# Altium schematic sheet P1.schdoc
size 420 x 298 mm; Symbol: Sheet-Symbol_A3; Company: 深圳嘉立创科技发展有限公司; Drawed: 嘉立创EDA; Reviewed: 嘉立创EDA; Version: V0.1; Page Size: A3; Part Number: JLCPCB-001; @Page No: 1; @Page Name: P1; Convert to PCB: yes; Add into BOM: yes; @Project Name: DAPlink-DOWN; @Page Count: 1; @Update Date: 2023-02-24; @Create Date: 2022-05-03; @Schematic Name: Schematic1; Device: Sheet-Symbol_A3
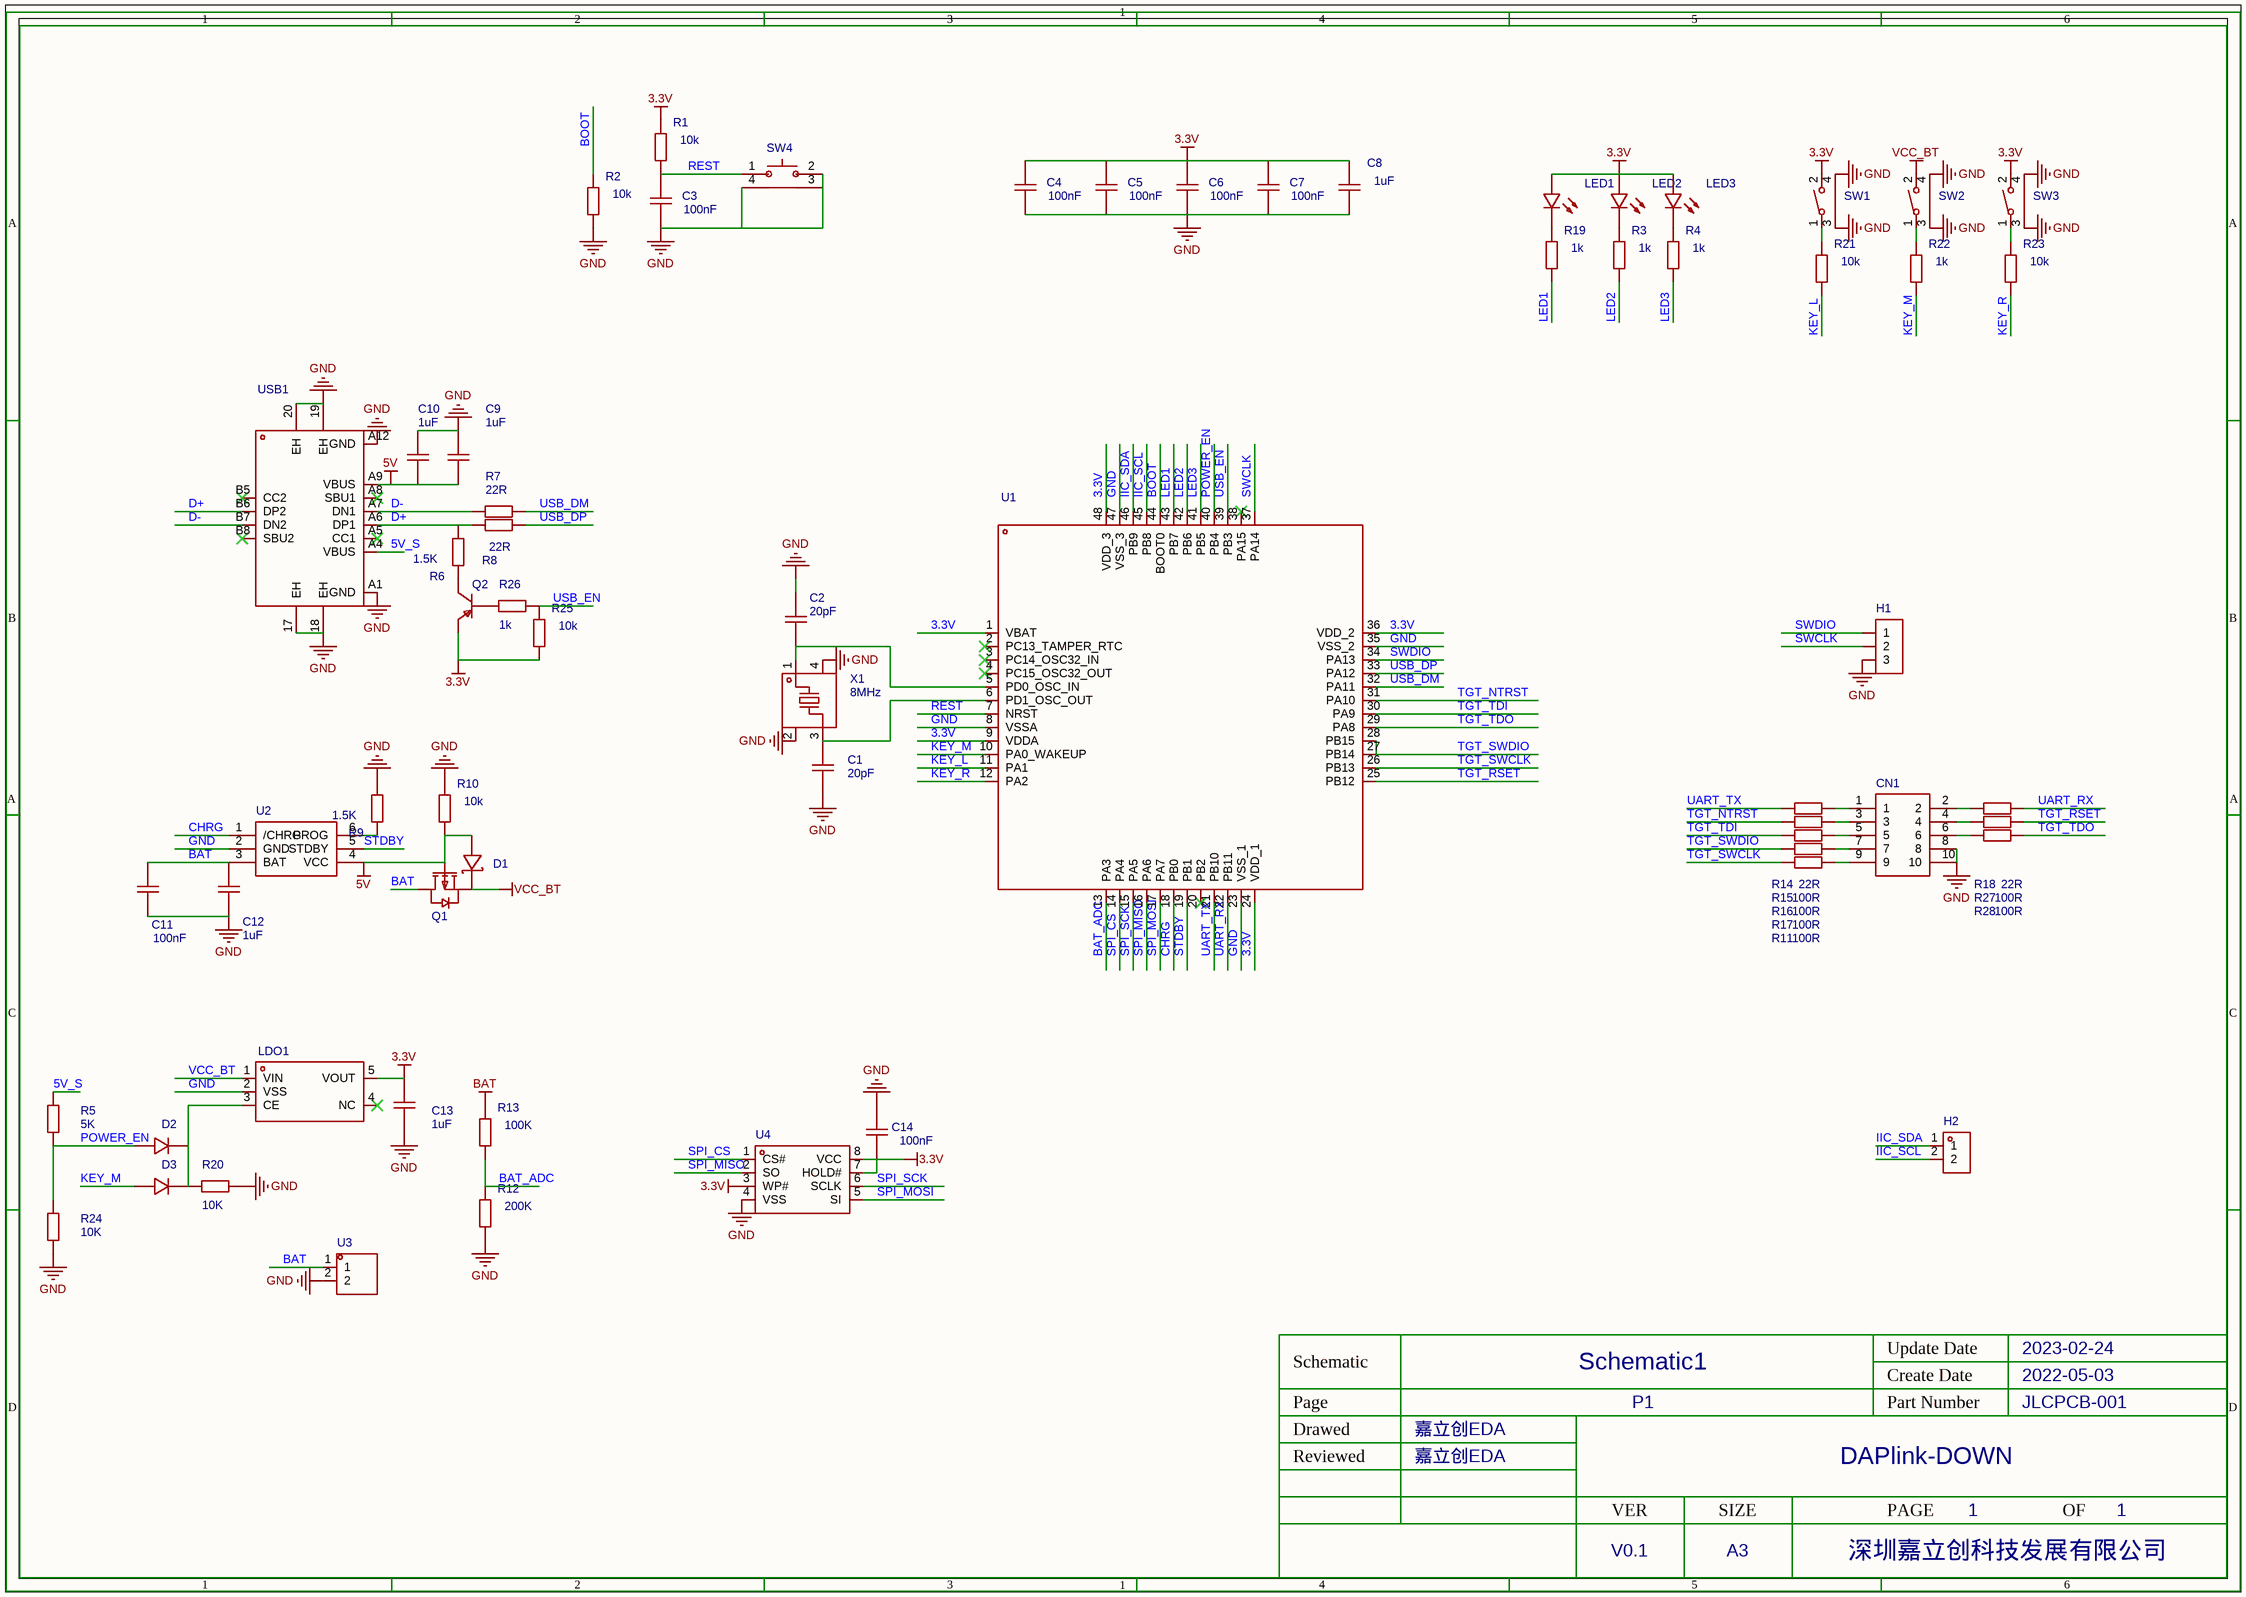
[diagram p0: P1.schdoc]

## Parts
C1  value 20pF  [C0402]
C2  value 20pF  [C0402]
C3  value 100nF  [C0402]
C4  value 100nF  [C0402]
C5  value 100nF  [C0402]
C6  value 100nF  [C0402]
C7  value 100nF  [C0402]
C8  value 1uF  [C0603]
C9  value 1uF  [C0603]
C10  value 1uF  [C0805]
C11  value 100nF  [C0402]
C12  value 1uF  [C0603]
C13  value 1uF  [C0603]
C14  value 100nF  [C0402]
CN1  (no value)  [IDC-TH_10P-P2.54_Z-231012010106]
D1  (no value)  [SOD-123_L2.8-W1.8-LS3.7-RD]
D2  1N4007WS  [SOD-323_L1.8-W1.3-LS2.5-RD]  (value not drawn)
D3  1N4007WS  [SOD-323_L1.8-W1.3-LS2.5-RD]  (value not drawn)
H1  (no value)  [HDR-TH_3P-P2.54-V-M-1]
H2  PZ254V-11-02P  [HDR-TH_2P-P2.54-V-M]  (value not drawn)
LDO1  (no value)  [SOT-23-5_L3.0-W1.7-P0.95-LS2.8-BR]
LED1  (no value)  [LED0603-R-RD]
LED2  (no value)  [LED0603-R-RD]
LED3  (no value)  [LED0603-R-RD]
Q1  (no value)  [SOT-23-3_L2.9-W1.3-P1.90-LS2.4-BR]
Q2  S8550  [SOT-23-3_L2.9-W1.6-P1.90-LS2.8-BR]  (value not drawn)
R1  value 10k  [R0402]
R2  value 10k  [R0402]
R3  value 1k  [R0402]
R4  value 1k  [R0402]
R5  value 5K  [R0402]
R6  value 1.5K  [R0402]
R7  value 22R  [R0402]
R8  value 22R  [R0402]
R9  value 1.5K  [R0402]
R10  value 10k  [R0402]
R11  value 100R  [R0402]
R12  value 200K  [R0402]
R13  value 100K  [R0402]
R14  value 22R  [R0402]
R15  value 100R  [R0402]
R16  value 100R  [R0402]
R17  value 100R  [R0402]
R18  value 22R  [R0402]
R19  value 1k  [R0402]
R20  value 10K  [R0402]
R21  value 10k  [R0402]
R22  value 1k  [R0402]
R23  value 10k  [R0402]
R24  value 10K  [R0402]
R25  value 10k  [R0402]
R26  value 1k  [R0402]
R27  value 100R  [R0402]
R28  value 100R  [R0402]
SW1  (no value)  [SW-TH_TS-1093C-A6B3-D1]
SW2  (no value)  [SW-TH_TS-1093C-A6B3-D1]
SW3  (no value)  [SW-TH_TS-1093C-A6B3-D1]
SW4  1TS003B-1400-3500A-CT  [KEY-SMD_1TS003B]  (value not drawn)
U1  (no value)  [LQFP-48_L7.0-W7.0-P0.50-LS9.0-BL]
U2  (no value)  [SOT-23-6_L2.9-W1.6-P0.95-LS2.8-BR]
U3  (no value)  [CONN-TH_T2B-SQ-LF-SN]
U4  (no value)  [SOP-8_L5.3-W5.2-P1.27-LS7.9-BL]
USB1  (no value)  [USB-C-SMD_TYPE-C-16P-QTGM027]
X1  value 8MHz  [OSC-SMD_4P-L3.2-W2.5-BL]

## Nets
3.3V: C4.2 C5.2 C6.2 C7.2 C8.2 C13.2 C14.1 LDO1.5(VOUT) LED1.1(A) LED2.1(A) LED3.1(A) Q2.2 R1.2 R25.1 SW1.2 SW3.2 U1.1(VBAT) U1.9(VDDA) U1.24(VDD_1) U1.36(VDD_2) U1.48(VDD_3) U4.3(WP#) U4.7(HOLD#) U4.8(VCC)
5V: C9.1 C10.1 D1.2(A) Q1.1(G) R10.1 U2.4(VCC) USB1.A9(VBUS)
BAT: C11.2 C12.2 Q1.3(D) R13.2 U2.3(BAT) U3.1
GND: C1.2 C2.1 C3.1 C4.1 C5.1 C6.1 C7.1 C8.1 C9.2 C10.2 C11.1 C12.1 C13.1 C14.2 CN1.8 CN1.10 H1.3 LDO1.2(VSS) R2.1 R9.1 R10.2 R12.1 R20.1 R24.1 SW1.3(EP) SW1.4(EP) SW2.3(EP) SW2.4(EP) SW3.3(EP) SW3.4(EP) SW4.2 SW4.3 SW4.4 U1.8(VSSA) U1.23(VSS_1) U1.35(VSS_2) U1.47(VSS_3) U2.2(GND) U3.2 U4.4(VSS) USB1.17(EH) USB1.18(EH) USB1.19(EH) USB1.20(EH) USB1.A1(GND) USB1.A12(GND) X1.2(GND) X1.4(GND)
VCC_BT: D1.1(K) LDO1.1(VIN) Q1.2(S) SW2.2
5V_S: R5.2 USB1.A4(VBUS)
BAT_ADC: R12.2 R13.1 U1.13(PA3)
BOOT: R2.2 U1.44(BOOT0)
CHRG: U1.18(PB0) U2.1(/CHRG)
D+: R6.1 R8.2 USB1.A6(DP1) USB1.B6(DP2)
D-: R7.1 USB1.A7(DN1) USB1.B7(DN2)
IIC_SCL: H2.2 U1.45(PB8)
IIC_SDA: H2.1 U1.46(PB9)
KEY_L: R21.1 U1.11(PA1)
KEY_M: D3.2(A) R22.1 U1.10(PA0_WAKEUP)
KEY_R: R23.1 U1.12(PA2)
LED1: R19.1 U1.43(PB7)
LED2: R3.1 U1.42(PB6)
LED3: R4.1 U1.41(PB5)
POWER_EN: D2.2(A) R5.1 R24.2 U1.40(PB4)
REST: C3.2 R1.1 SW4.1 U1.7(NRST)
SPI_CS: U1.14(PA4) U4.1(CS#)
SPI_MISO: U1.16(PA6) U4.2(SO)
SPI_MOSI: U1.17(PA7) U4.5(SI)
SPI_SCK: U1.15(PA5) U4.6(SCLK)
STDBY: U1.19(PB1) U2.5(STDBY)
SWCLK: H1.2 U1.37(PA14)
SWDIO: H1.1 U1.34(PA13)
TGT_NTRST: R15.2 U1.31(PA10)
TGT_RSET: R27.1 U1.25(PB12)
TGT_SWCLK: R11.2 U1.26(PB13)
TGT_SWDIO: R17.2 U1.27(PB14) U1.28(PB15)
TGT_TDI: R16.2 U1.30(PA9)
TGT_TDO: R28.1 U1.29(PA8)
UART_RX: R18.1 U1.22(PB11)
UART_TX: R14.2 U1.21(PB10)
USB_DM: R7.2 U1.32(PA11)
USB_DP: R8.1 U1.33(PA12)
USB_EN: R25.2 R26.1 U1.39(PB3)
NetC1_1: C1.1 U1.6(PD1_OSC_OUT) X1.3
NetC2_2: C2.2 U1.5(PD0_OSC_IN) X1.1
NetCN1_1: CN1.1 R14.1
NetCN1_2: CN1.2 R18.2
NetCN1_3: CN1.3 R15.1
NetCN1_4: CN1.4 R27.2
NetCN1_5: CN1.5 R16.1
NetCN1_6: CN1.6 R28.2
NetCN1_7: CN1.7 R17.1
NetCN1_9: CN1.9 R11.1
NetD2_1: D2.1(K) D3.1(K) LDO1.3(CE) R20.2
NetLED1_2: LED1.2(K) R19.2
NetLED2_2: LED2.2(K) R3.2
NetLED3_2: LED3.2(K) R4.2
NetQ2_1: Q2.1 R26.2
NetQ2_3: Q2.3 R6.2
NetR9_2: R9.2 U2.6(PROG)
NetR21_2: R21.2 SW1.1
NetR22_2: R22.2 SW2.1
NetR23_2: R23.2 SW3.1

Not connected (* = marked no-connect by the designer): LDO1 4(NC)*; U1 2(PC13_TAMPER_RTC)* 3(PC14_OSC32_IN)* 4(PC15_OSC32_OUT)* 20(PB2)* 38(PA15)*; USB1 A5(CC1)* A8(SBU1)* B5(CC2)* B8(SBU2)*

## Notes on the sheet
- 1
- 2
- 3
- 4
- 5
- 6
- A
- B
- C
- Update Date
- 2023-02-24
- D
- Schematic
- Page
- P1
- Schematic1
- Create Date
- Part Number
- JLCPCB-001
- 2022-05-03
- Reviewed
- Drawed
- 嘉立创EDA
- DAPlink-DOWN
- VER
- V0.1
- SIZE
- A3
- PAGE
- 深圳嘉立创科技发展有限公司
- OF

## Library data of the parts
C1 C2 = GCM1555C1H200JA16D: 容值:20pF;精度:±5%;额定电压:-;温度系数:-;; Manufacturer: muRata(村田); AddInBom: yes; ModelId: 36a51122f27c49738f86b3bfa98863e0; ModelName: C0402_L1.0-W0.5-H0.5; ModelTransform: 39.37,19.685,0,0,0,0,0,0,0; Tolerance: ±5%; Device: GCM1555C1H200JA16D; Symbol: GCM1555C1H200JA16D; LCSC Part Name: 20pF(200) ±5% 50V; SupplierPart: C343868; ManufacturerPart: GCM1555C1H200JA16D; Supplier Footprint: 0402; JLCPCB Part Class: Extended Part; Datasheet: https://atta.szlcsc.com/upload/public/pdf/source/20200713/C701256_2542DCDD70722D2BE0CCE4799A0421BC.pdf; Supplier: LCSC; ConvertToPcb: yes; FootprintName: C0402; Voltage Rated: -; Temperature Coefficient: -
C3-C7 C11 C14 = CC0402CRNPO9BN100: 容值:10pF;精度:±0.25pF;额定电压:50V;温度系数:NP0;; Manufacturer: YAGEO(国巨); AddInBom: yes; ModelId: 36a51122f27c49738f86b3bfa98863e0; ModelName: C0402_L1.0-W0.5-H0.5; ModelTransform: 39.37,19.685,0,0,0,0,0,0,0; Tolerance: ±0.25pF; Voltage Rated: 50V; Temperature Coefficient: NP0; Device: CC0402CRNPO9BN100; Symbol: CC0402CRNPO9BN100; LCSC Part Name: 10pF ±0.25pF 50V; SupplierPart: C526974; ManufacturerPart: CC0402CRNPO9BN100; Supplier Footprint: 0402; JLCPCB Part Class: Extended Part; Datasheet: https://atta.szlcsc.com/upload/public/pdf/source/20200508/C526974_3517A3A30DC68049E27EE400BC6F4C82.pdf; Supplier: LCSC; ConvertToPcb: yes; FootprintName: C0402
C8 C9 C12 C13 = C0603C102K1RAC3083: 容值:1nF;精度:±10%;额定电压:100V;温度系数:X7R;; Manufacturer: KEMET(基美); AddInBom: yes; ModelId: ac125912035d415993ca9572d50418b1; ModelName: C0603_L1.6-W0.8-H0.8; ModelTransform: 62.992,31.496,0,0,0,0,0,0,0; Tolerance: ±10%; Voltage Rated: 100V; Temperature Coefficient: X7R; Device: C0603C102K1RAC3083; Symbol: C0603C102K1RAC3083; LCSC Part Name: 1nF ±10% 100V; SupplierPart: C561818; ManufacturerPart: C0603C102K1RAC3083; Supplier Footprint: 0603; JLCPCB Part Class: Extended Part; Datasheet: https://atta.szlcsc.com/upload/public/pdf/source/20200618/C599608_2B9CFB7169FD5127D28BF69D59417288.pdf; Supplier: LCSC; ConvertToPcb: yes; FootprintName: C0603
C10 = CS0805KKX7R8BB105: 容值:1uF;精度:±10%;额定电压:25V;温度系数:X7R;; Manufacturer: YAGEO(国巨); AddInBom: yes; ModelId: 1ba041120af144c991958decab20d241; ModelName: C0805_L2.0-W1.3-H1.3; ModelTransform: 78.74,51.181,0,0,0,0,0,0.0005,0; Tolerance: ±10%; Voltage Rated: 25V; Temperature Coefficient: X7R; Device: CS0805KKX7R8BB105; Symbol: CS0805KKX7R8BB105; LCSC Part Name: 1uF ±10% 25V; SupplierPart: C272869; ManufacturerPart: CS0805KKX7R8BB105; Supplier Footprint: 0805; JLCPCB Part Class: Extended Part; Datasheet: https://atta.szlcsc.com/upload/public/pdf/source/20180820/C272869_BA73BCEFB473D3E1AF31EC64F07F73BB.pdf; Supplier: LCSC; ConvertToPcb: yes; FootprintName: C0805
CN1 = Z-231012010106: 连接器类型:简牛座;间距:2.54mm;每排PIN数:5;排数:2;行距:2.54mm;封装形式:弯插;触头材质:黄铜;触头镀层:金;; Manufacturer: Nextron(台湾正凌); AddInBom: yes; ModelId: cfab4efc165d46e49e768f1b13086717; ModelTransform: 800,519.7,0,0,0,0,0,-196.8,-114.2; Connector Type: 简牛座; Pitch: 2.54mm; Pin Number in each Row: 5; Holder Type: 弯插; Device: Z-231012010106; Symbol: Z-231012010106; LCSC Part Name: 2.54mm 每排P数:5 排数:2 黑色; SupplierPart: C221046; ManufacturerPart: Z-231012010106; Supplier Footprint: 插件,P=2.54mm; JLCPCB Part Class: Extended Part; Datasheet: https://atta.szlcsc.com/upload/public/pdf/source/20180731/C221046_3D77A431ED26A6EF3F95CE9E156A590C.pdf; Supplier: LCSC; ConvertToPcb: yes; FootprintName: IDC-TH_10P-P2.54_Z-231012010106; ModelName: IDC-TH_10P-P2.54_Z-231012010106; Number of Rows: 2; Row Spacing: 2.54mm; Contact Material: 黄铜; Contact Plating: 金
D1 = DSK24 K24: 直流反向耐压(Vr):40V;平均整流电流(Io):2A;正向压降(Vf):550mV@2A;; Manufacturer: MDD; AddInBom: yes; ModelId: 7884390a25fb4c08947731ebfba7e3f8; ModelTransform: 144.9,63,0,0,0,0,0,0,0; Reverse Voltage (Vr): 40V; Average Rectified Current (Io): 2A; Device: DSK24 K24; Symbol: DSK24 K24; LCSC Part Name: 40V 2A 550mV@2A; SupplierPart: C64890; ManufacturerPart: DSK24 K24; Supplier Footprint: SOD-123FL; JLCPCB Part Class: Extended Part; Datasheet: https://atta.szlcsc.com/upload/public/pdf/source/20190305/C64890_FF2133F90E969198891C9074DED26AB5.pdf; Supplier: LCSC; ConvertToPcb: yes; FootprintName: SOD-123_L2.8-W1.8-LS3.7-RD; ModelName: SOD-123_L2.8-W1.8-LS3.7-RD; Forward Voltage (Vf@If): 550mV@2A
D2 D3 = 1N4007WS: 1000V,1A,VF=1.1V@1A，M7小封装; Manufacturer: MDD; AddInBom: yes; ModelId: e9dd044ee7bf4221b3b795eb56bce7c0; ModelName: SOD-323_L1.7-W1.3-H1.1-LS2.5; ModelTransform: 98.91933,51.181,0,180,0,0,0.985,-0.0005,0; Device: 1N4007WS; Symbol: 1N4007WS; LCSC Part Name: 1N4007WS; SupplierPart: C193404; ManufacturerPart: 1N4007WS; Supplier Footprint: SOD-323; JLCPCB Part Class: 扩展库; Datasheet: https://atta.szlcsc.com/upload/public/pdf/source/20180525/C193404_0C623596A90FA1D1FBDCFE625FBC3C97.pdf; Supplier: LCSC; ConvertToPcb: yes; FootprintName: SOD-323_L1.8-W1.3-LS2.5-RD
H1 = 2.54-1*3P针: 间距:2.54mm;总PIN位数:3;排数:1;插针结构:-;行距:-;安装类型:直插;圆针/方针:-;额定电流:-;额定电压:-;配合针长度:-;塑高:-;触头材质:-;触头镀层:-;颜色:黑色;; Manufacturer: BOOMELE(博穆精密); Symbol: Header-Male-2.54_1x3; AddInBom: yes; ModelId: 94a8ffe137b6410295cb18cd3ffd99db; ModelName: HDR-M-2.54_1x3; ModelTransform: 300,100,0,0,0,0,0,0,-118.1; Pitch: 2.54mm; Device: 2.54-1*3P针; LCSC Part Name: 2.54mm; SupplierPart: C49257; ManufacturerPart: 2.54-1*3P针; Supplier Footprint: 插件; JLCPCB Part Class: Extended Part; Datasheet: https://atta.szlcsc.com/upload/public/pdf/source/20151109/1457707570948.pdf; Supplier: LCSC; ConvertToPcb: yes; FootprintName: HDR-TH_3P-P2.54-V-M-1; Number of Pins: 3; Number of Rows: 1; Pin Structure: -; Row Spacing: -; Mounting Type: 直插; Circluar Pins/Square Pins: -; Current Rating (Max): -; Voltage Rating (Max): -; Length of Mating Pin: -; Insulation Height: -; Contact Material: -; Contact Plating: -; Color: 黑色
H2 = PZ254V-11-02P: 排数:单排;总PIN位数:2;间距:2.54mm;插针结构:1x2P;行距:-;安装类型:直插;圆针/方针:方针;额定电流:-;额定电压:-;配合针长度:6mm;塑高:2.5mm;端接针长度:3mm;触头材质:黄铜;触头镀层:-;工作温度范围:-40℃~+105℃;颜色:黑色;; Manufacturer: XFCN(兴飞); AddInBom: yes; ModelId: e35305ec3aa84b66b849f914b715e73f; ModelName: HDR2.54-M-LI-1X2P; ModelTransform: 200,100,0,0,0,0,0,0,-118.11; Pitch: 2.54mm; Pin Structure: 1x2P; Circluar Pins/Square Pins: 方针; Device: PZ254V-11-02P; Symbol: PZ254V-11-02P; LCSC Part Name: 2.54mm 1x2P 直插 方针; SupplierPart: C492401; ManufacturerPart: PZ254V-11-02P; Supplier Footprint: 直插,P=2.54mm; JLCPCB Part Class: 扩展库; Datasheet: https://atta.szlcsc.com/upload/public/pdf/source/20200309/C492401_A812433581A9B211A7FFA413ADDFF0E5.pdf; Supplier: LCSC; ConvertToPcb: yes; FootprintName: HDR-TH_2P-P2.54-V-M; Number of Rows: 单排; Number of Pins: 2; Row Spacing: -; Mounting Type: 直插; Current Rating (Max): -; Voltage Rating (Max): -; Length of Mating Pin: 6mm; Insulation Height: 2.5mm; Length of End Connection Pin: 3mm; Contact Material: 黄铜; Contact Plating: -; Operating Temperature Range: -40℃~+105℃; Color: 黑色
LDO1 = ME6211C33M5G-N: 输出类型:固定;输出极性:正;输出通道数:1;最大输入电压:6V;输出电压:3.3V;压差:260mV@(200mA);输出电流:500mA;电源纹波抑制比(PRSS):70dB@(1kHz),62dB@(10kHz);; Manufacturer: MICRONE(南京微盟); AddInBom: yes; ModelId: 0a2a1b8f50944f73965918ad6e5fe167; ModelName: SOT-23-5_L2.9-W1.6-H1.1-LS2.8-P0.95; ModelTransform: 114.2,109.6,0,180,0,0,-0.9,0.9,0; Output Type: 固定; Output Polarity: 正; Number of Outputs: 1; Maximum Input Voltage: 6V; Output Voltage: 3.3V; Output Current: 500mA; Device: ME6211C33M5G-N; Symbol: ME6211C33M5G-N; LCSC Part Name: Vin=6V Vout=3.3V 500mA 70dB@(1kHz),62dB@(10kHz); SupplierPart: C82942; ManufacturerPart: ME6211C33M5G-N; Supplier Footprint: SOT-23-5; JLCPCB Part Class: Extended Part; Datasheet: https://atta.szlcsc.com/upload/public/pdf/source/20170918/C82942_1505727073070976520.pdf; Supplier: LCSC; ConvertToPcb: yes; FootprintName: SOT-23-5_L3.0-W1.7-P0.95-LS2.8-BR; Dropout Voltage: 260mV@(200mA); Power Supply Rejection Ratio (PRSS): 70dB@(1kHz),62dB@(10kHz)
LED1-LED3 = NCD0603B4: 发光颜色:蓝灯;; Manufacturer: 国星光电; Symbol: FC-F1608BK-470H5; AddInBom: yes; ModelId: eca76de2c48042b48052f5876bb6c831; ModelTransform: 63.7794,31.496,0,0,0,0,0,0,0; Emitted Color: 蓝灯; Device: NCD0603B4; LCSC Part Name: 蓝灯; SupplierPart: C89814; ManufacturerPart: NCD0603B4; Supplier Footprint: 0603; JLCPCB Part Class: Extended Part; Datasheet: https://atta.szlcsc.com/upload/public/pdf/source/20200820/C89814_3D11357C976AB31B19046E836063F91D.pdf; Supplier: LCSC; ConvertToPcb: yes; FootprintName: LED0603-R-RD; ModelName: LED0603-R-RD
Q1 = AO3423: 类型:P沟道;漏源电压(Vdss):20V;连续漏极电流(Id):4.5A;功率(Pd):1.25W;导通电阻(RDS(on)@Vgs,Id):35mΩ@10V,5.1A;阈值电压(Vgs(th)@Id):1.5V@250A;; Manufacturer: VBsemi(台湾微碧); Symbol: AO3423_C692958; AddInBom: yes; ModelId: c62791f0466c4ae2a892c056b845b0ca; ModelName: SOT-23-3P_L2.9-W1.3-H1.0-LS2.4-P0.95; ModelTransform: 98.425,114.173,0,180,0,0,0.0005,-0.0005,0; Type: P沟道; Drain Source Voltage (Vdss): 20V; Continuous Drain Current (Id): 4.5A; Power Dissipation (Pd): 1.25W; Gate Threshold Voltage (Vgs(th)@Id): 1.5V@250A; Device: AO3423; LCSC Part Name: P沟道 20V 4.5A; SupplierPart: C692958; ManufacturerPart: AO3423; Supplier Footprint: SOT-23-3; JLCPCB Part Class: Extended Part; Datasheet: https://atta.szlcsc.com/upload/public/pdf/source/20200629/C692958_8E3397F4108F33A40C5B9FD9962FA608.pdf; Supplier: LCSC; ConvertToPcb: yes; FootprintName: SOT-23-3_L2.9-W1.3-P1.90-LS2.4-BR; Drain Source On Resistance (RDS(on)@Vgs,Id): 35mΩ@10V,5.1A
Q2 = S8550_C105432: 晶体管类型:PNP;集射极击穿电压(Vceo):25V;集电极电流(Ic):500mA;功率(Pd):300mW;集电极截止电流(Icbo):100nA;集电极-发射极饱和电压(VCE(sat)@Ic,Ib):600mV@500mA,50mA;直流电流增益(hFE@Ic,Vce):120@50mA,1V;特征频率(fT):150MHz;工作温度:+150℃@(Tj);; Manufacturer: CJ(江苏长电/长晶); AddInBom: yes; ModelId: 89cb27a44ab2466697082bb9fd73a7d0; ModelName: SOT-23-3L_L2.9-W1.6-H1.1-LS2.8-P0.95; ModelTransform: 110.236,114.173,0,180,0,0,-0.005,0.0005,0; Transistor Type: PNP; Collector-Emitter Breakdown Voltage (Vceo): 25V; Collector Current (Ic): 500mA; Power Dissipation (Pd): 300mW; Collector Cut-Off Current (Icbo): 100nA; Transition Frequency (fT): 150MHz; Device: S8550_C105432; Symbol: S8550_C105432; LCSC Part Name: PNP 25V 500mA L档120-200; SupplierPart: C105432; ManufacturerPart: S8550; Supplier Footprint: SOT-23-3L; JLCPCB Part Class: 基础库; Datasheet: https://atta.szlcsc.com/upload/public/pdf/source/20170413/1492062713649.pdf; Supplier: LCSC; ConvertToPcb: yes; FootprintName: SOT-23-3_L2.9-W1.6-P1.90-LS2.8-BR; Collector-Emitter Saturation Voltage (VCE(sat)@Ic,Ib): 600mV@500mA,50mA; DC Current Gain (hFE@Ic,Vce): 120@50mA,1V; Operating Temperature: +150℃@(Tj)
R1-R28 = RT0402BRD0722KL: 电阻类型:薄膜电阻;阻值:22kΩ;精度:±0.1%;功率:62.5mW;温度系数:±25ppm/;最大工作电压:50V;工作温度范围:-55~+155;; Manufacturer: YAGEO(国巨); Temperature Coefficient: ±25ppm/; AddInBom: yes; ModelId: 671aefced39d4c318694bba8bd8efd39; ModelName: R0402_L1.0-W0.5-H0.5; ModelTransform: 39.37,19.685,0,0,0,0,0,0.0005,0; Tolerance: ±0.1%; Power(Watts): 62.5mW; Overload Voltage (Max): 50V; Operating Temperature Range: -55~+155; Device: RT0402BRD0722KL; Symbol: RT0402BRD0722KL; LCSC Part Name: 22kΩ ±0.1%; ManufacturerPart: RT0402BRD0722KL; Supplier Footprint: 0402; JLCPCB Part Class: Extended Part; Datasheet: https://atta.szlcsc.com/upload/public/pdf/source/20181031/C326601_1F60CD1C11470B123D5B3D7B2D1FCF5A.pdf; Supplier: LCSC; ConvertToPcb: yes; FootprintName: R0402; Type: 薄膜电阻
  R1-R11 R13-R21 R23-R28: SupplierPart: C326601
SW1-SW3 = TS-1093C-A6B2-D1: Manufacturer: Yuandi(台湾元迪); AddInBom: yes; ModelId: 26f11acad36d436c84df48611cac55ec; ModelTransform: 320.6,386.7,0,0,0,0,0,-63.1,-137.8; Device: TS-1093C-A6B2-D1; Symbol: TS-1093C-A6B2-D1; LCSC Part Name: 轻触开关6*6*6.5带支架插件按键四脚侧按180gf; SupplierPart: C2682917; ManufacturerPart: TS-1093C-A6B2-D1; Supplier Footprint: 插件,6x6x6.5mm; JLCPCB Part Class: Extended Part; Datasheet: https://atta.szlcsc.com/upload/public/pdf/source/20210107/C2682912_A8F430B4F140DAC81FB7E2D14E5A08CF.pdf; Supplier: LCSC; ConvertToPcb: yes; FootprintName: SW-TH_TS-1093C-A6B3-D1; ModelName: SW-TH_TS-1093C-A6B3-D1
SW4 = 1TS003B-1400-3500A-CT: 触点电流:50mA;额定电压(DC):12V;额定功率:0.6W;绝缘电阻:100MΩ;电路结构:单刀单掷;安装方式:卧贴;按钮形状:矩形按钮;按钮/盖帽颜色:黑色;带灯:无;作用力:140gf@±30gf;机械寿命:50000;工作温度:-40℃~+90℃;引脚样式:J型引脚;开关长度:4.6mm;开关宽度:1.82mm;开关高度:3.5mm;带支架:否;; Manufacturer: HYP(鸿源精密); AddInBom: yes; ModelId: d59c0297adac4306a1d4ba4f2a7de8bf; ModelName: KEY-SMD_L4.6-W2.3-H1.8-P3.4; ModelTransform: 181.102,139.7635,0,0,0,0,-0.009,-28.544,-19.685; Contact Current: 50mA; Voltage Rating (DC): 12V; Power Rating: 0.6W; Insulation Resistance: 100MΩ; Circuit: 单刀单掷; Actuator Style: 矩形按钮; Actuator/Cap Color: 黑色; With Lamp: 无; Mechanical Life: 50000; Pin Style: J型引脚; Switch Length: 4.6mm; Switch Width: 1.82mm; Switch Height: 3.5mm; Strike Gundam: 否; Device: 1TS003B-1400-3500A-CT; Symbol: 1TS003B-1400-3500A; LCSC Part Name: 半包带柱轻触开关 白色两个弹片  塑胶按钮; SupplierPart: C319392; ManufacturerPart: 1TS003B-1400-3500A-CT; Supplier Footprint: SMD,4.6x1.82mm; JLCPCB Part Class: 扩展库; Datasheet: https://atta.szlcsc.com/upload/public/pdf/source/20181106/C319392_EA06B27D310AC8B4E1BA9275A0C91ACF.pdf; Supplier: LCSC; ConvertToPcb: yes; FootprintName: KEY-SMD_1TS003B; Mounting Style: 卧贴; Operating Force: 140gf@±30gf; Operating Temperature: -40℃~+90℃
U1 = GD32F103CBT6: CPU内核:ARM Cortex-M3;CPU最大主频:108MHz;工作电压范围:2.6V~3.6V;内部振荡器:有;外部时钟频率范围:3MHz~32MHz;程序 FLASH容量:128KB;RAM总容量:20KB;EEPROM/数据 FLASH容量:-;GPIO端口数量:37;ADC(单元数/通道数/位数):2@x12bit;DAC(单元数/通道数/位数):-;(E)PWM(单元数/通道数/位数):1@x16bit;8位Timer数量:-;16位Timer数量:3;32位Timer数量:-;内部比较器; Manufacturer: GigaDevice(兆易创新); AddInBom: yes; ModelId: 093be70396ff421eb2cdb946d5311efc; ModelName: LQFP-48_L7.0-W7.0-H1.4-LS9.0-P0.50; ModelTransform: 354.3,354.3,0,0,0,0,0,0,0; Maximum Frequency: 108MHz; Internal Oscillator: 有; Program FLASH Size: 128KB; RAM Size: 20KB; GPIO Ports Number: 37; 16Bit Timer Number: 3; I2C Number: 2; CAN Number: 1; USB (H/D/OTG): 全速USB Device; Peripherals / Functions / Protocol Stacks: 片载温度传感器；DMA；看门狗；LIN总线协议；PWM；IrDA；SDIO；RTC实时时钟; Operating Temperature Range: -40~+85; Device: GD32F103CBT6; Symbol: GD32F103CBT6; LCSC Part Name: GD32F103CBT6; SupplierPart: C77979; ManufacturerPart: GD32F103CBT6; Supplier Footprint: LQFP-48_7x7x05P; JLCPCB Part Class: Extended Part; Datasheet: https://atta.szlcsc.com/upload/public/pdf/source/20160910/1473490275421.pdf; Supplier: LCSC; ConvertToPcb: yes; FootprintName: LQFP-48_L7.0-W7.0-P0.50-LS9.0-BL; CPU Core: ARM Cortex-M3; Supply Voltage Range: 2.6V~3.6V; External Clock Frequency Rang: 3MHz~32MHz; EEPROM/Data FLASH Size: -; ADC (Units/Channels/bits): 2@x12bit; DAC (Units/Channels/bits): -; (E)PWM (Units/Channels/bits): 1@x16bit; 8Bit Timer Number: -; 32Bit Timer Number: -; CMP Number: -; U(S)ART Number: 3; I2S Number: -; (Q)SPI Number: 2
U2 = TP4059: 充电电池的类型:-;电池单元组数:-;最大充电电流:-;充满的电池组电压:-;最大供应电压:-;; Manufacturer: TOPPOWER(南京拓微); AddInBom: yes; ModelId: 18da8f6c14a34920b3e136b5c401a119; ModelName: SOT-23-6_L2.9-W1.6-H1.5-LS2.8-P0.95; ModelTransform: 110.7,114.2,0,180,0,0,0,0,0; Device: TP4059; Symbol: TP4059; LCSC Part Name: TP4059; SupplierPart: C80364; ManufacturerPart: TP4059; Supplier Footprint: SOT-23-6; JLCPCB Part Class: Extended Part; Datasheet: https://atta.szlcsc.com/upload/public/pdf/source/20161128/1480296095027.pdf; Supplier: LCSC; ConvertToPcb: yes; FootprintName: SOT-23-6_L2.9-W1.6-P0.95-LS2.8-BR; Battery Chemistry: -; Number of Cells: -; Charge Current - Max: -; Battery Pack Voltage: -; Voltage - Supply (Max): -; Interface: -
U3 = T2B-SQ(LF)(SN): Manufacturer: JST; AddInBom: yes; ModelId: 56efb3bde5a34c4d8b168c6906234046; ModelName: CONN-TH_T2B-SQ(LF)(SN); ModelTransform: 200,94.5,0,0,0,0,0,0,-118.1; Device: T2B-SQ(LF)(SN); Symbol: T2B-SQ(LF)(SN); LCSC Part Name: T2B-SQ(LF)(SN); SupplierPart: C265429; ManufacturerPart: T2B-SQ(LF)(SN); Supplier Footprint: 插件,P=2.54mm; JLCPCB Part Class: Extended Part; Datasheet: https://atta.szlcsc.com/upload/public/pdf/source/20190115/C265429_C14C29889883140BDA304A73A8EC7CF8.pdf; Supplier: LCSC; ConvertToPcb: yes; FootprintName: CONN-TH_T2B-SQ-LF-SN
U4 = GD25Q128ESIG: 存储器类型:-;存储器构架(格式):-;技术:-;存储器容量:-;时钟频率:-;存储器接口类型:-;; Manufacturer: GigaDevice(兆易创新); AddInBom: yes; ModelId: b3bace262c53465a9e6115a2e0c7b3cc; ModelTransform: 205.9,311,0,0,0,0,0,0,0; Device: GD25Q128ESIG; Symbol: GD25Q128ESIG; LCSC Part Name: GD25Q128ESIG; SupplierPart: C2758105; ManufacturerPart: GD25Q128ESIG; Supplier Footprint: SOP-8; JLCPCB Part Class: Extended Part; Datasheet: https://atta.szlcsc.com/upload/public/pdf/source/20210423/C2758105_5B8FF46BBA9FF880A5F3E50B6815040C.pdf; Supplier: LCSC; ConvertToPcb: yes; FootprintName: SOP-8_L5.3-W5.2-P1.27-LS7.9-BL; ModelName: SOP-8_L5.3-W5.2-P1.27-LS7.9-BL; Memory Type: -; Memory Format: -; Technology: -; Memory Size: -; Clock Frequency: -; Byte-Program Time - tBP: -; Page Programming Time - tPP: -; Memory Interface: -; Voltage - Supply: -; Operating Temperature: -
USB1 = TYPE-C 16P QTGM027: 连接器类型:Type-C;标准:-;公母:母座;触点数量:16;端口数量:1;安装方式:卧贴;额定电流 - 电源:3A;工作温度范围:-30~+80;; Manufacturer: SHOU HAN(首韩); AddInBom: yes; ModelId: 23a4a22a604646cabb08998501ada542; ModelTransform: 460.6,303.1,0,0,0,0,0,-50.4,-31.5; Connector Type: Type-C; Gender: 母座; Number of Contacts: 16; Number of Ports: 1; Current Rating - Power (Max): 3A; Operating Temperature Range: -30~+80; Device: TYPE-C 16P QTGM027; Symbol: TYPE-C 16P QTGM027; LCSC Part Name: Type-C 母座 卧贴 不锈钢外壳 2次模顶; SupplierPart: C2681552; ManufacturerPart: TYPE-C 16P QTGM027; Supplier Footprint: SMD; JLCPCB Part Class: Extended Part; Datasheet: https://atta.szlcsc.com/upload/public/pdf/source/20210224/C2681552_6D044BA0C1A7352EAF06092454113915.pdf; Supplier: LCSC; ConvertToPcb: yes; FootprintName: USB-C-SMD_TYPE-C-16P-QTGM027; ModelName: USB-C-SMD_TYPE-C-16P-QTGM027; Standard: -; Mounting Style: 卧贴
X1 = X32258MOB4SI: 晶振类型:贴片无源晶振;频率:8MHz;频率公差:±10ppm;频率稳定度:±30ppm;负载电容:12pF;工作温度:-40~+85;; Manufacturer: YXC扬兴科技; AddInBom: yes; ModelId: ae22b8d143894765bc8100c37cb6356f; ModelName: OSC-SMD_4P-L3.2-W2.5-H1.0; ModelTransform: 125.984,98.425,0,0,0,0,0,0.005,0; Crystal Type: 贴片无源晶振; Frequency Tolerance: ±10ppm; Frequency Stability: ±30ppm; Load Capacitance: 12pF; Operating Temperature: -40~+85; Device: X32258MOB4SI; Symbol: X32258MOB4SI; LCSC Part Name: YSX321SL 8MHz 12pF ±10ppm; SupplierPart: C2682775; ManufacturerPart: X32258MOB4SI; Supplier Footprint: SMD3225-4P; JLCPCB Part Class: Extended Part; Datasheet: https://atta.szlcsc.com/upload/public/pdf/source/20210106/C2682774_0CD4FDA5D9DA3FBEEC23BD607A48E4B0.pdf; Supplier: LCSC; ConvertToPcb: yes; FootprintName: OSC-SMD_4P-L3.2-W2.5-BL